# Altium schematic sheet RK3568-DDR-PHY.SchDoc
size 420 x 297 mm; SheetNumber: 5; SheetTotal: 25
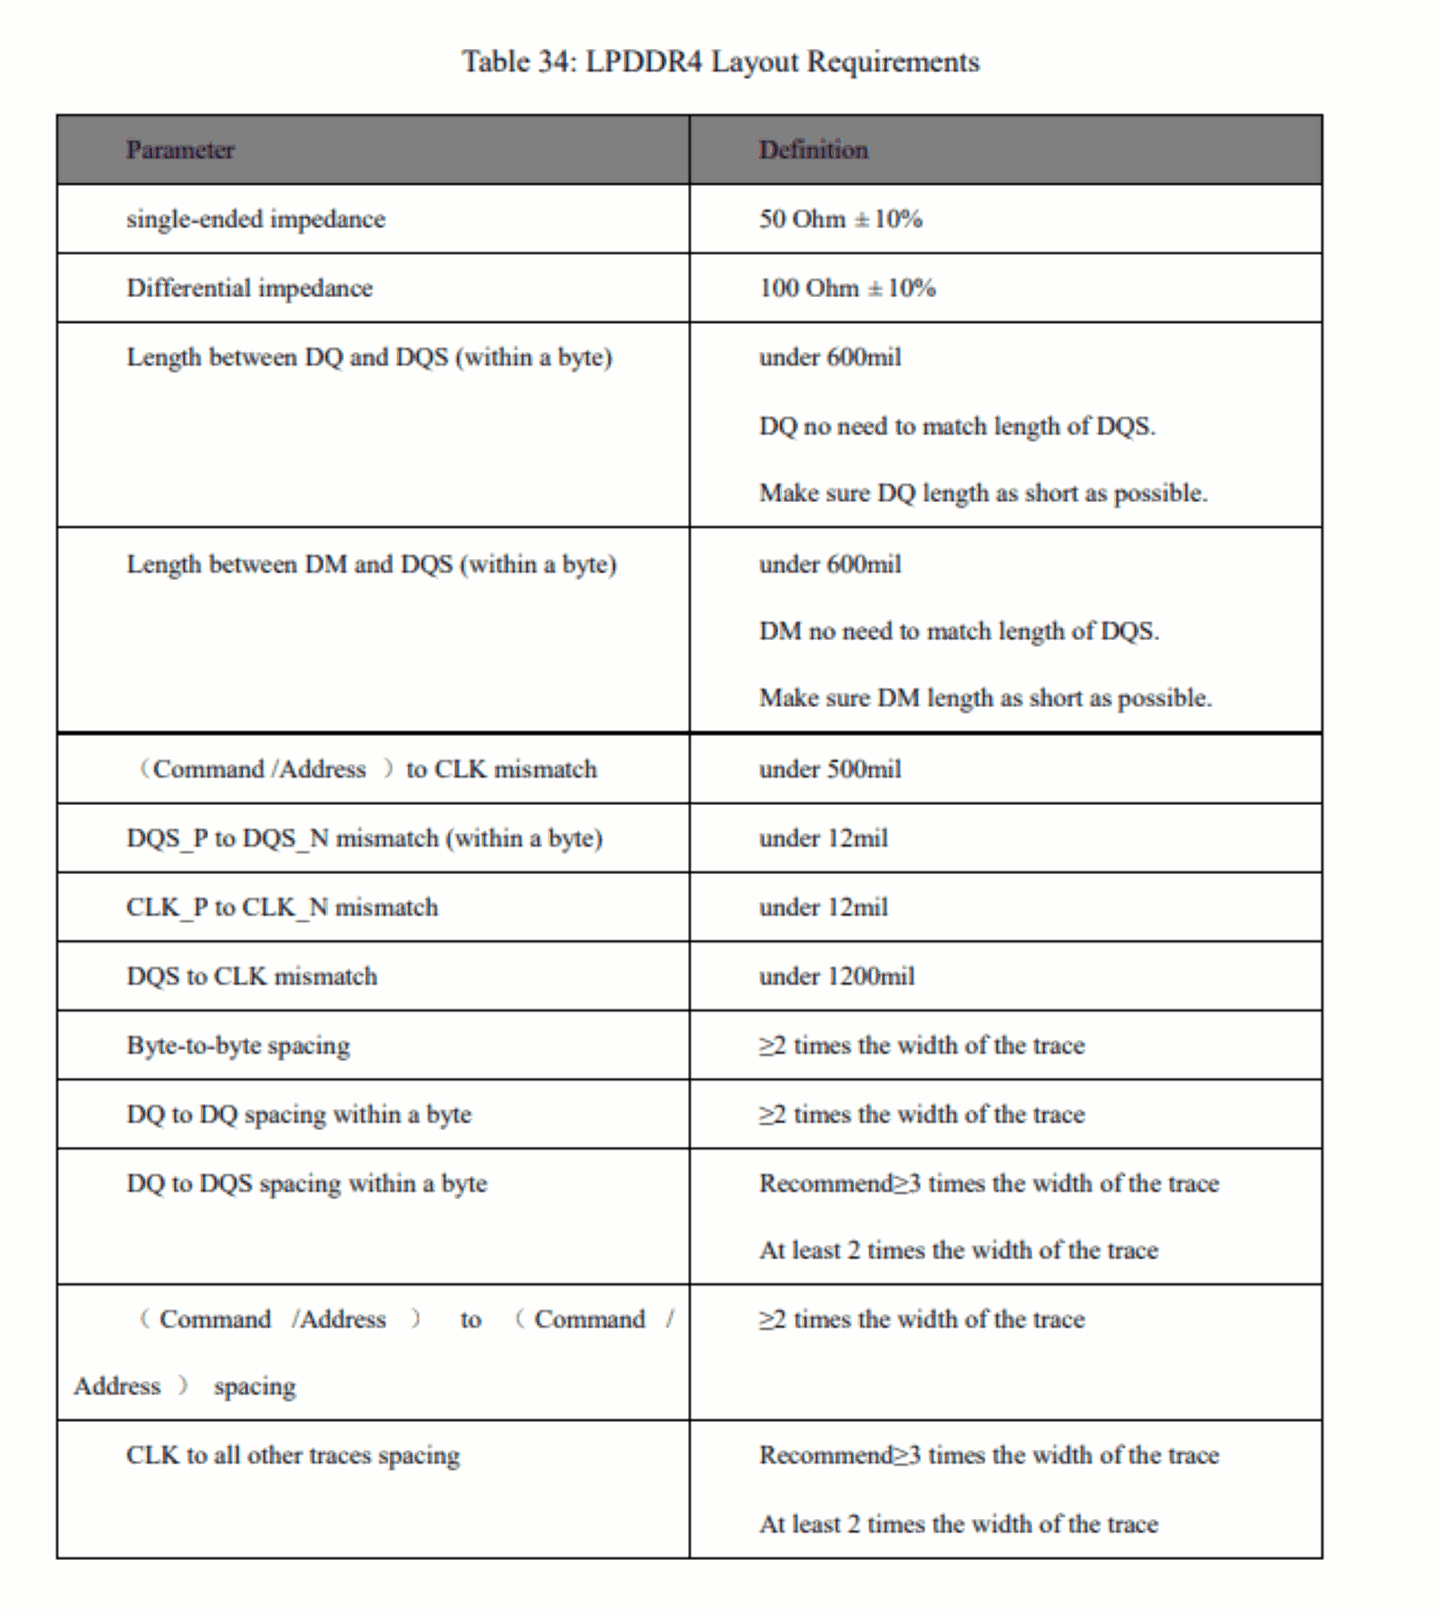
[diagram p0: RK3568-DDR-PHY.SchDoc, left]
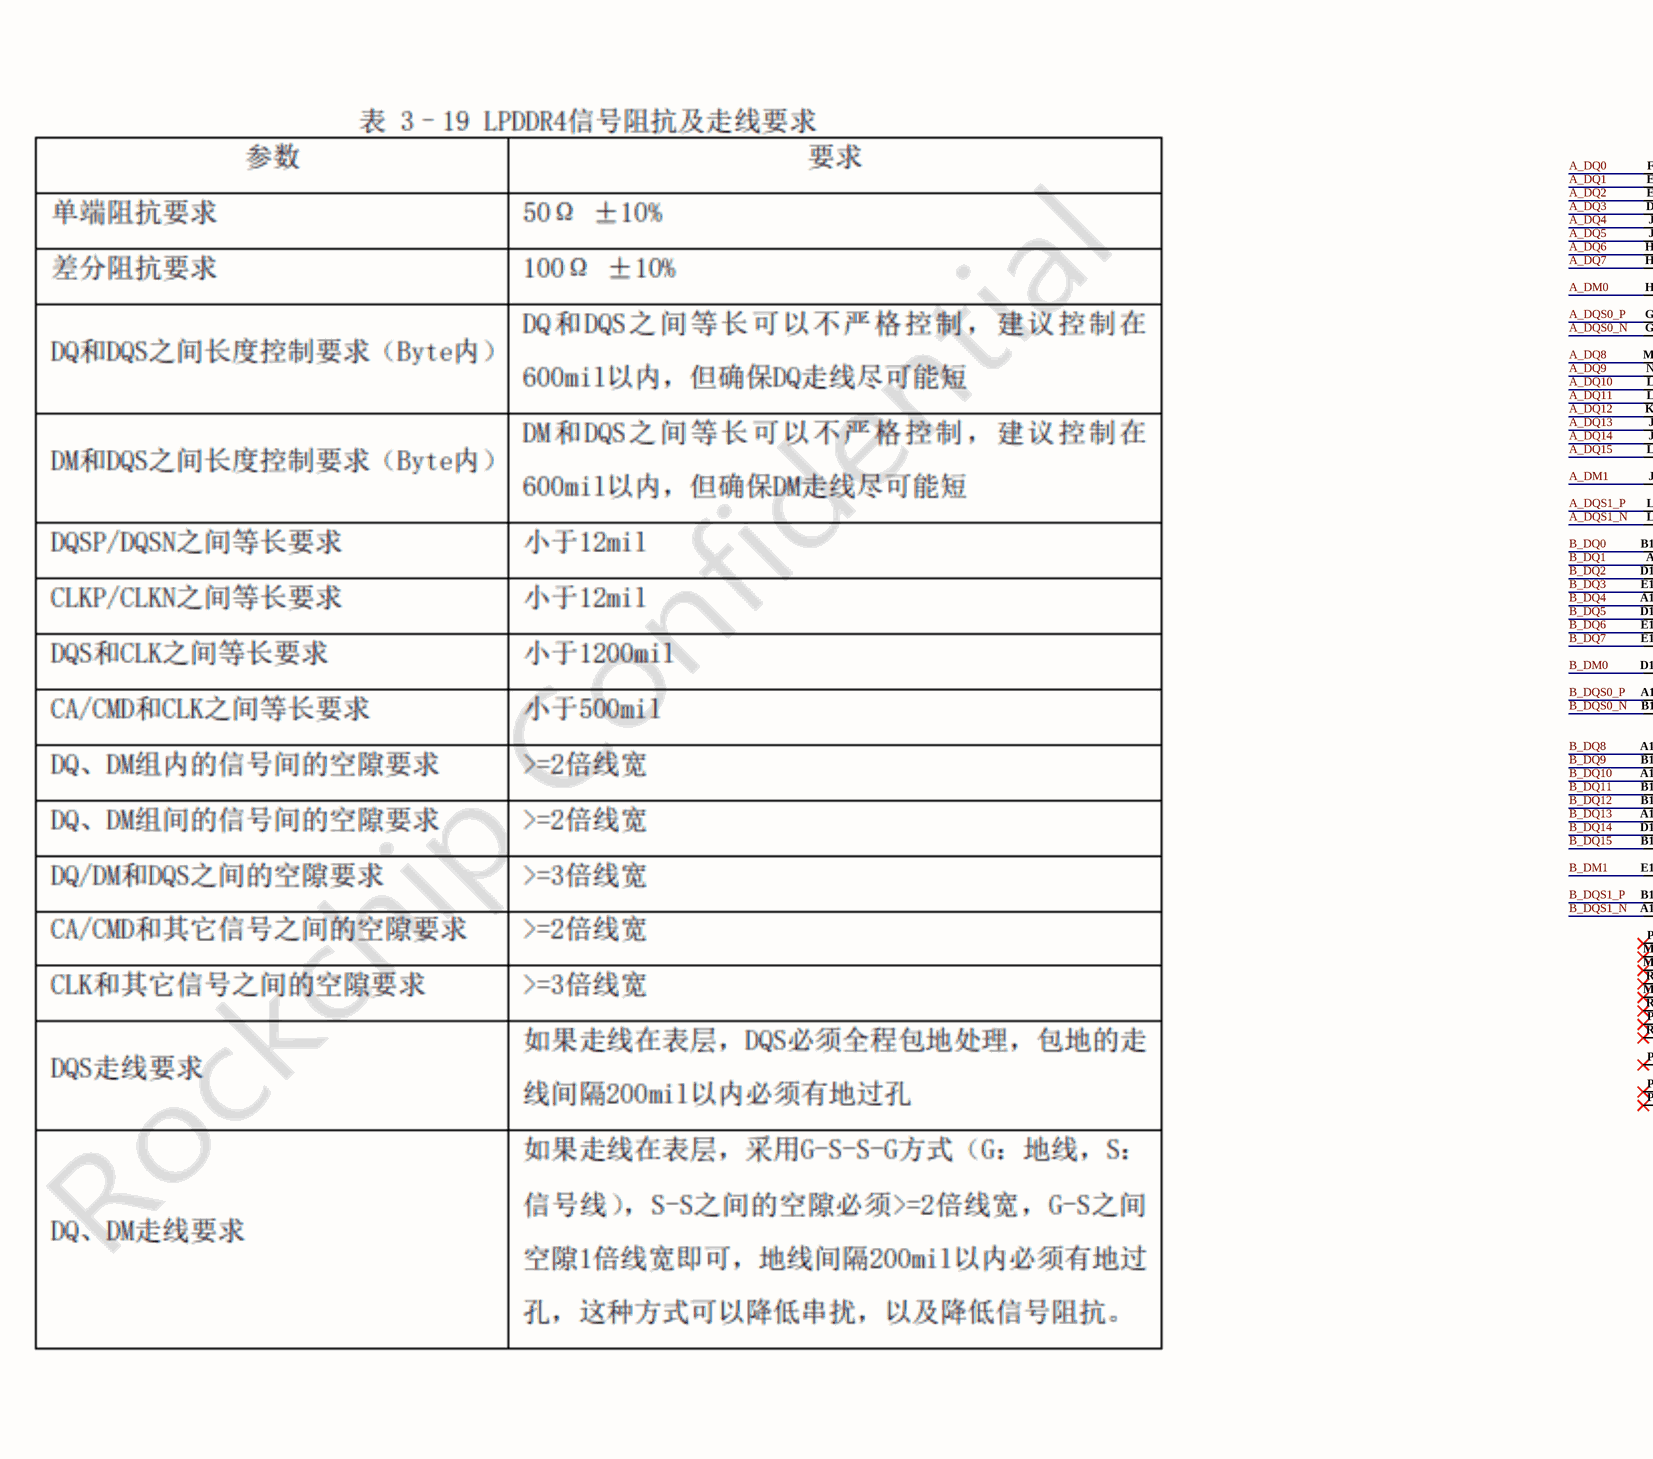
[diagram p1: RK3568-DDR-PHY.SchDoc, middle]
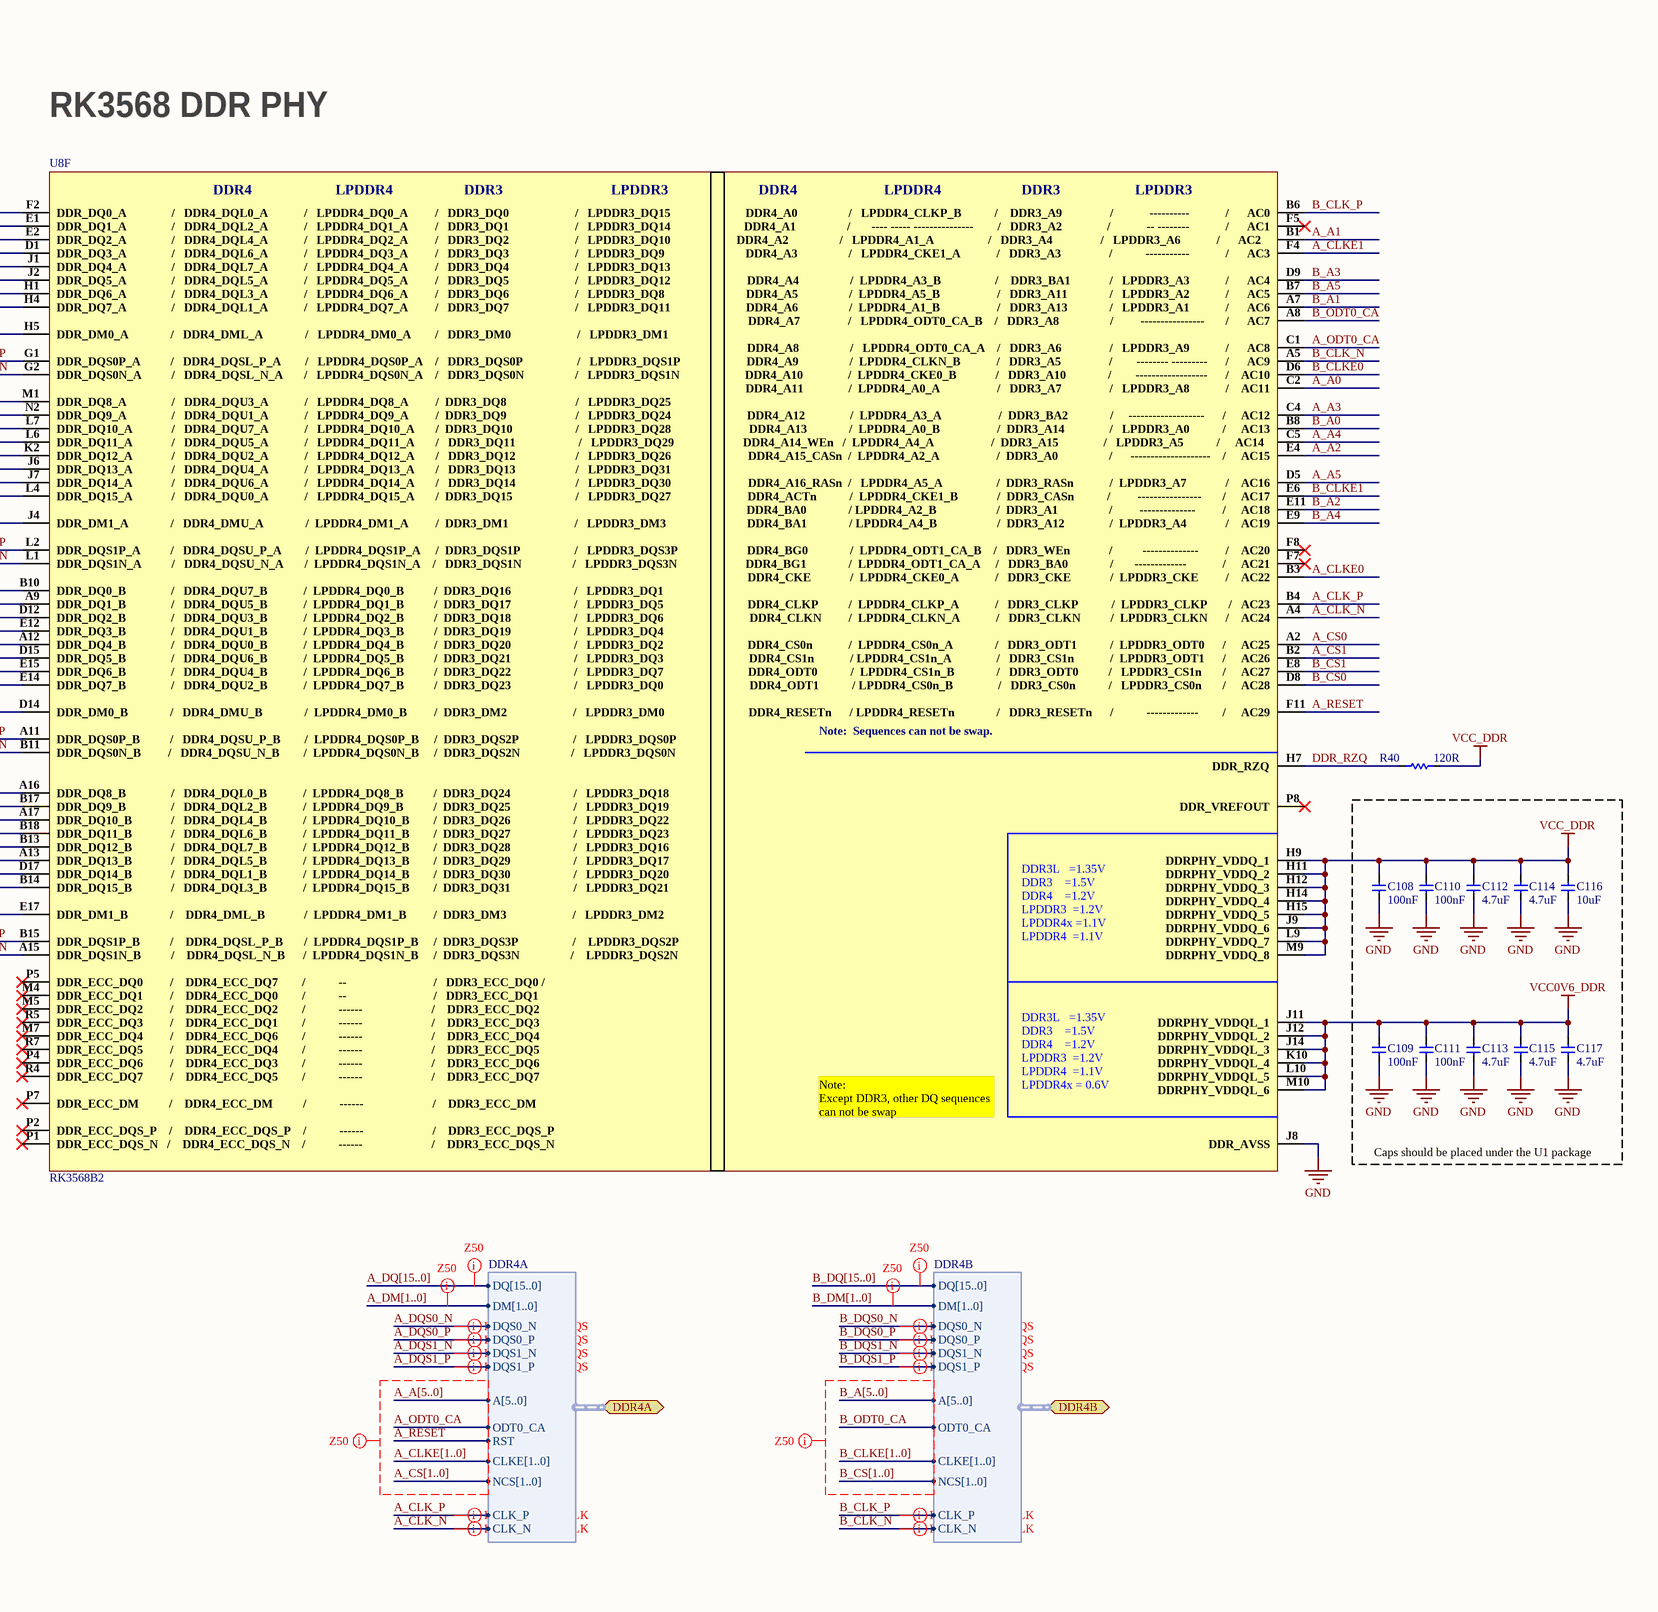
[diagram p2: RK3568-DDR-PHY.SchDoc, right]

## Parts
C108  100nF  [CAP-0201]
C109  100nF  [CAP-0201]
C110  100nF  [CAP-0201]
C111  100nF  [CAP-0201]
C112  4.7uF  [Cap-0402]
C113  4.7uF  [Cap-0402]
C114  4.7uF  [Cap-0402]
C115  4.7uF  [Cap-0402]
C116  10uF  [Cap-0603]
C117  4.7uF  [Cap-0402]
R40  120R  [Res-0201]
U8  RK3568B2  [FCCSP-636L]  (part F of 23)

## Ports
DDR4A (bidir, harness DDR4A, see DRAM-LPDDR4x-Sheet[2A]), DDR4B (bidir, harness DDR4B, see DRAM-LPDDR4x-Sheet[2B])

## Harnesses
DDR4A: DQ[15..0], DM[1..0], DQS0_N, DQS0_P, DQS1_N, DQS1_P, A[5..0], ODT0_CA, RST, CLKE[1..0], NCS[1..0], CLK_P, CLK_N
DDR4B: DQ[15..0], DM[1..0], DQS0_N, DQS0_P, DQS1_N, DQS1_P, A[5..0], ODT0_CA, CLKE[1..0], NCS[1..0], CLK_P, CLK_N

## Nets
GND: C108.1 C109.1 C110.1 C111.1 C112.1 C113.1 C114.1 C115.1 C116.1 C117.1 U8.J8(DDR_AVSS)
VCC0V6_DDR: C109.2 C111.2 C113.2 C115.2 C117.2 U8.J11(DDRPHY_VDDQL_1) U8.J12(DDRPHY_VDDQL_2) U8.J14(DDRPHY_VDDQL_3) U8.K10(DDRPHY_VDDQL_4) U8.L10(DDRPHY_VDDQL_5) U8.M10(DDRPHY_VDDQL_6)
VCC_DDR: C108.2 C110.2 C112.2 C114.2 C116.2 R40.2 U8.H9(DDRPHY_VDDQ_1) U8.H11(DDRPHY_VDDQ_2) U8.H12(DDRPHY_VDDQ_3) U8.H14(DDRPHY_VDDQ_4) U8.H15(DDRPHY_VDDQ_5) U8.J9(DDRPHY_VDDQ_6) U8.L9(DDRPHY_VDDQ_7) U8.M9(DDRPHY_VDDQ_8)
A_A0: U8.C2(DDR4_A11_______________/__LPDDR4_A0_A___________________/___DDR3_A7________________/___LPDDR3_A8____________/____AC11)
A_A1: U8.B1(DDR4_A2_________________/___LPDDR4_A1_A__________________/___DDR3_A4________________/___LPDDR3_A6____________/______AC2)
A_A2: U8.E4(DDR4_A15_CASn__/__LPDDR4_A2_A___________________/__DDR3_A0_________________/______--------------------____/_____AC15)
A_A3: U8.C4(DDR4_A12_______________/__LPDDR4_A3_A___________________/__DDR3_BA2______________/_____-------------------______/_____AC12)
A_A4: U8.C5(DDR4_A14_WEn___/__LPDDR4_A4_A___________________/__DDR3_A15_______________/___LPDDR3_A5___________/_____AC14)
A_A5: U8.D5(DDR4_A16_RASn__/___LPDDR4_A5_A__________________/__DDR3_RASn____________/__LPDDR3_A7_____________/____AC16)
A_CLK_N: U8.A4(DDR4_CLKN_________/__LPDDR4_CLKN_A____________/___DDR3_CLKN__________/__LPDDR3_CLKN______/____AC24) ; port DDR4A.CLK_N
A_CLK_P: U8.B4(DDR4_CLKP__________/__LPDDR4_CLKP_A____________/___DDR3_CLKP___________/__LPDDR3_CLKP_______/___AC23) ; port DDR4A.CLK_P
A_CLKE0: U8.B3(DDR4_CKE_____________/__LPDDR4_CKE0_A____________/___DDR3_CKE_____________/__LPDDR3_CKE_________/____AC22)
A_CLKE1: U8.F4(DDR4_A3_________________/___LPDDR4_CKE1_A____________/___DDR3_A3________________/___________-----------____________/______AC3)
A_CS0: U8.A2(DDR4_CS0n____________/__LPDDR4_CS0n_A______________/___DDR3_ODT1___________/__LPDDR3_ODT0______/_____AC25)
A_CS1: U8.B2(DDR4_CS1n____________/_LPDDR4_CS1n_A_______________/___DDR3_CS1n____________/__LPDDR3_ODT1______/_____AC26)
A_DM0: U8.H5(DDR_DM0_A______________/___DDR4_DML_A______________/___LPDDR4_DM0_A________/___DDR3_DM0______________________/___LPDDR3_DM1)
A_DM1: U8.J4(DDR_DM1_A______________/___DDR4_DMU_A______________/__LPDDR4_DM1_A_________/__DDR3_DM1______________________/___LPDDR3_DM3)
A_DQ0: U8.F2(DDR_DQ0_A_______________/___DDR4_DQL0_A____________/___LPDDR4_DQ0_A_________/___DDR3_DQ0______________________/___LPDDR3_DQ15)
A_DQ1: U8.E1(DDR_DQ1_A_______________/___DDR4_DQL2_A____________/___LPDDR4_DQ1_A_________/___DDR3_DQ1______________________/___LPDDR3_DQ14)
A_DQ2: U8.E2(DDR_DQ2_A_______________/___DDR4_DQL4_A____________/___LPDDR4_DQ2_A_________/___DDR3_DQ2______________________/___LPDDR3_DQ10)
A_DQ3: U8.D1(DDR_DQ3_A_______________/___DDR4_DQL6_A____________/___LPDDR4_DQ3_A_________/___DDR3_DQ3______________________/___LPDDR3_DQ9)
A_DQ4: U8.J1(DDR_DQ4_A_______________/___DDR4_DQL7_A____________/___LPDDR4_DQ4_A_________/___DDR3_DQ4______________________/___LPDDR3_DQ13)
A_DQ5: U8.J2(DDR_DQ5_A_______________/___DDR4_DQL5_A____________/___LPDDR4_DQ5_A_________/___DDR3_DQ5______________________/___LPDDR3_DQ12)
A_DQ6: U8.H1(DDR_DQ6_A_______________/___DDR4_DQL3_A____________/___LPDDR4_DQ6_A_________/___DDR3_DQ6______________________/___LPDDR3_DQ8)
A_DQ7: U8.H4(DDR_DQ7_A_______________/___DDR4_DQL1_A____________/___LPDDR4_DQ7_A_________/___DDR3_DQ7______________________/___LPDDR3_DQ11)
A_DQ8: U8.M1(DDR_DQ8_A_______________/___DDR4_DQU3_A____________/___LPDDR4_DQ8_A_________/__DDR3_DQ8_______________________/___LPDDR3_DQ25)
A_DQ9: U8.N2(DDR_DQ9_A_______________/___DDR4_DQU1_A____________/___LPDDR4_DQ9_A_________/__DDR3_DQ9_______________________/___LPDDR3_DQ24)
A_DQ10: U8.L7(DDR_DQ10_A_____________/___DDR4_DQU7_A____________/___LPDDR4_DQ10_A_______/__DDR3_DQ10_____________________/___LPDDR3_DQ28)
A_DQ11: U8.L6(DDR_DQ11_A_____________/___DDR4_DQU5_A____________/___LPDDR4_DQ11_A_______/___DDR3_DQ11_____________________/___LPDDR3_DQ29)
A_DQ12: U8.K2(DDR_DQ12_A_____________/___DDR4_DQU2_A____________/___LPDDR4_DQ12_A_______/___DDR3_DQ12____________________/___LPDDR3_DQ26)
A_DQ13: U8.J6(DDR_DQ13_A_____________/___DDR4_DQU4_A____________/___LPDDR4_DQ13_A_______/___DDR3_DQ13____________________/___LPDDR3_DQ31)
A_DQ14: U8.J7(DDR_DQ14_A_____________/___DDR4_DQU6_A____________/___LPDDR4_DQ14_A_______/___DDR3_DQ14____________________/___LPDDR3_DQ30)
A_DQ15: U8.L4(DDR_DQ15_A_____________/___DDR4_DQU0_A____________/___LPDDR4_DQ15_A_______/__DDR3_DQ15_____________________/___LPDDR3_DQ27)
A_DQS0_N: U8.G2(DDR_DQS0N_A__________/___DDR4_DQSL_N_A_______/___LPDDR4_DQS0N_A____/___DDR3_DQS0N_________________/___LPDDR3_DQS1N) ; port DDR4A.DQS0_N
A_DQS0_P: U8.G1(DDR_DQS0P_A__________/___DDR4_DQSL_P_A________/___LPDDR4_DQS0P_A____/___DDR3_DQS0P__________________/___LPDDR3_DQS1P) ; port DDR4A.DQS0_P
A_DQS1_N: U8.L1(DDR_DQS1N_A__________/___DDR4_DQSU_N_A_______/__LPDDR4_DQS1N_A____/___DDR3_DQS1N_________________/___LPDDR3_DQS3N) ; port DDR4A.DQS1_N
A_DQS1_P: U8.L2(DDR_DQS1P_A__________/___DDR4_DQSU_P_A________/__LPDDR4_DQS1P_A_____/__DDR3_DQS1P__________________/___LPDDR3_DQS3P) ; port DDR4A.DQS1_P
A_ODT0_CA: U8.C1(DDR4_A8_________________/___LPDDR4_ODT0_CA_A____/___DDR3_A6________________/___LPDDR3_A9____________/______AC8) ; port DDR4A.ODT0_CA
A_RESET: U8.F11(DDR4_RESETn______/_LPDDR4_RESETn______________/___DDR3_RESETn______/___________-------------________/_____AC29) ; port DDR4A.RST
B_A0: U8.B8(DDR4_A13______________/__LPDDR4_A0_B___________________/__DDR3_A14_______________/___LPDDR3_A0___________/_____AC13)
B_A1: U8.A7(DDR4_A6_________________/__LPDDR4_A1_B___________________/___DDR3_A13______________/___LPDDR3_A1____________/______AC6)
B_A2: U8.E11(DDR4_BA0______________/_LPDDR4_A2_B____________________/__DDR3_A1_________________/_________--------------_________/_____AC18)
B_A3: U8.D9(DDR4_A4_________________/__LPDDR4_A3_B__________________/____DDR3_BA1_____________/___LPDDR3_A3____________/______AC4)
B_A4: U8.E9(DDR4_BA1______________/_LPDDR4_A4_B____________________/__DDR3_A12_______________/__LPDDR3_A4_____________/____AC19)
B_A5: U8.B7(DDR4_A5_________________/__LPDDR4_A5_B___________________/___DDR3_A11______________/___LPDDR3_A2____________/______AC5)
B_CLK_N: U8.A5(DDR4_A9_________________/__LPDDR4_CLKN_B____________/___DDR3_A5________________/________--------_---------______/______AC9) ; port DDR4B.CLK_N
B_CLK_P: U8.B6(DDR4_A0_________________/___LPDDR4_CLKP_B___________/____DDR3_A9________________/____________----------____________/______AC0) ; port DDR4B.CLK_P
B_CLKE0: U8.D6(DDR4_A10_______________/__LPDDR4_CKE0_B_____________/___DDR3_A10______________/________------------------______/____AC10)
B_CLKE1: U8.E6(DDR4_ACTn___________/__LPDDR4_CKE1_B_____________/__DDR3_CASn___________/_________----------------_______/_____AC17)
B_CS0: U8.D8(DDR4_ODT1___________/_LPDDR4_CS0n_B_______________/___DDR3_CS0n___________/___LPDDR3_CS0n_______/_____AC28)
B_CS1: U8.E8(DDR4_ODT0___________/__LPDDR4_CS1n_B______________/___DDR3_ODT0__________/___LPDDR3_CS1n_______/_____AC27)
B_DM0: U8.D14(DDR_DM0_B______________/___DDR4_DMU_B______________/__LPDDR4_DM0_B_________/__DDR3_DM2______________________/___LPDDR3_DM0)
B_DM1: U8.E17(DDR_DM1_B______________/____DDR4_DML_B_____________/__LPDDR4_DM1_B_________/__DDR3_DM3______________________/___LPDDR3_DM2)
B_DQ0: U8.B10(DDR_DQ0_B_______________/___DDR4_DQU7_B____________/__LPDDR4_DQ0_B__________/__DDR3_DQ16_____________________/___LPDDR3_DQ1)
B_DQ1: U8.A9(DDR_DQ1_B_______________/___DDR4_DQU5_B____________/__LPDDR4_DQ1_B__________/__DDR3_DQ17_____________________/___LPDDR3_DQ5)
B_DQ2: U8.D12(DDR_DQ2_B_______________/___DDR4_DQU3_B____________/__LPDDR4_DQ2_B__________/__DDR3_DQ18_____________________/___LPDDR3_DQ6)
B_DQ3: U8.E12(DDR_DQ3_B_______________/___DDR4_DQU1_B____________/__LPDDR4_DQ3_B__________/__DDR3_DQ19_____________________/___LPDDR3_DQ4)
B_DQ4: U8.A12(DDR_DQ4_B_______________/___DDR4_DQU0_B____________/__LPDDR4_DQ4_B__________/__DDR3_DQ20_____________________/___LPDDR3_DQ2)
B_DQ5: U8.D15(DDR_DQ5_B_______________/___DDR4_DQU6_B____________/__LPDDR4_DQ5_B__________/__DDR3_DQ21_____________________/___LPDDR3_DQ3)
B_DQ6: U8.E15(DDR_DQ6_B_______________/___DDR4_DQU4_B____________/__LPDDR4_DQ6_B__________/__DDR3_DQ22_____________________/___LPDDR3_DQ7)
B_DQ7: U8.E14(DDR_DQ7_B_______________/___DDR4_DQU2_B____________/__LPDDR4_DQ7_B__________/__DDR3_DQ23_____________________/___LPDDR3_DQ0)
B_DQ8: U8.A16(DDR_DQ8_B_______________/___DDR4_DQL0_B____________/__LPDDR4_DQ8_B__________/__DDR3_DQ24_____________________/___LPDDR3_DQ18)
B_DQ9: U8.B17(DDR_DQ9_B_______________/___DDR4_DQL2_B____________/__LPDDR4_DQ9_B__________/__DDR3_DQ25_____________________/___LPDDR3_DQ19)
B_DQ10: U8.A17(DDR_DQ10_B_____________/___DDR4_DQL4_B____________/__LPDDR4_DQ10_B________/__DDR3_DQ26_____________________/___LPDDR3_DQ22)
B_DQ11: U8.B18(DDR_DQ11_B_____________/___DDR4_DQL6_B____________/__LPDDR4_DQ11_B________/__DDR3_DQ27_____________________/___LPDDR3_DQ23)
B_DQ12: U8.B13(DDR_DQ12_B_____________/___DDR4_DQL7_B____________/__LPDDR4_DQ12_B________/__DDR3_DQ28_____________________/___LPDDR3_DQ16)
B_DQ13: U8.A13(DDR_DQ13_B_____________/___DDR4_DQL5_B____________/__LPDDR4_DQ13_B________/__DDR3_DQ29_____________________/___LPDDR3_DQ17)
B_DQ14: U8.D17(DDR_DQ14_B_____________/___DDR4_DQL1_B____________/__LPDDR4_DQ14_B________/__DDR3_DQ30_____________________/___LPDDR3_DQ20)
B_DQ15: U8.B14(DDR_DQ15_B_____________/___DDR4_DQL3_B____________/__LPDDR4_DQ15_B________/__DDR3_DQ31_____________________/___LPDDR3_DQ21)
B_DQS0_N: U8.B11(DDR_DQS0N_B_________/___DDR4_DQSU_N_B________/__LPDDR4_DQS0N_B_____/__DDR3_DQS2N_________________/___LPDDR3_DQS0N) ; port DDR4B.DQS0_N
B_DQS0_P: U8.A11(DDR_DQS0P_B__________/___DDR4_DQSU_P_B________/__LPDDR4_DQS0P_B_____/__DDR3_DQS2P__________________/___LPDDR3_DQS0P) ; port DDR4B.DQS0_P
B_DQS1_N: U8.A15(DDR_DQS1N_B__________/____DDR4_DQSL_N_B______/__LPDDR4_DQS1N_B_____/__DDR3_DQS3N_________________/____LPDDR3_DQS2N) ; port DDR4B.DQS1_N
B_DQS1_P: U8.B15(DDR_DQS1P_B__________/____DDR4_DQSL_P_B_______/__LPDDR4_DQS1P_B_____/__DDR3_DQS3P__________________/____LPDDR3_DQS2P) ; port DDR4B.DQS1_P
B_ODT0_CA: U8.A8(DDR4_A7________________/___LPDDR4_ODT0_CA_B____/___DDR3_A8_________________/_________----------------_______/______AC7) ; port DDR4B.ODT0_CA
DDR_RZQ: R40.1 U8.H7(DDR_RZQ)

Not connected (* = marked no-connect by the designer): U8 F5(DDR4_A1_________________/_______----_-----_---------------________/___DDR3_A2_______________/____________--_--------____________/______AC1)* F7(DDR4_BG1______________/__LPDDR4_ODT1_CA_A_____/___DDR3_BA0______________/_______-------------____________/_____AC21)* F8(DDR4_BG0______________/__LPDDR4_ODT1_CA_B____/___DDR3_WEn_____________/__________--------------_________/____AC20)* M4(DDR_ECC_DQ1_________/____DDR4_ECC_DQ0________/___________--_____________________________/___DDR3_ECC_DQ1)* M5(DDR_ECC_DQ2_________/____DDR4_ECC_DQ2________/___________------_______________________/____DDR3_ECC_DQ2)* M7(DDR_ECC_DQ4_________/____DDR4_ECC_DQ6________/___________------_______________________/____DDR3_ECC_DQ4)* P1(DDR_ECC_DQS_N___/____DDR4_ECC_DQS_N____/___________------_______________________/____DDR3_ECC_DQS_N)* P2(DDR_ECC_DQS_P____/____DDR4_ECC_DQS_P____/___________------_______________________/____DDR3_ECC_DQS_P)* P4(DDR_ECC_DQ6_________/____DDR4_ECC_DQ3________/___________------_______________________/____DDR3_ECC_DQ6)* P5(DDR_ECC_DQ0_________/____DDR4_ECC_DQ7________/___________--_____________________________/___DDR3_ECC_DQ0_/________)* P7(DDR_ECC_DM__________/____DDR4_ECC_DM__________/___________------_______________________/____DDR3_ECC_DM)* P8(DDR_VREFOUT)* R4(DDR_ECC_DQ7_________/____DDR4_ECC_DQ5________/___________------_______________________/____DDR3_ECC_DQ7)* R5(DDR_ECC_DQ3_________/____DDR4_ECC_DQ1________/___________------_______________________/____DDR3_ECC_DQ3)* R7(DDR_ECC_DQ5_________/____DDR4_ECC_DQ4________/___________------_______________________/____DDR3_ECC_DQ5)*

## Buses and harness runs
bus A_A[5..0]
bus A_CLKE[1..0]
bus A_CS[1..0]
bus A_DM[1..0]
bus A_DQ[15..0]
bus B_A[5..0]
bus B_CLKE[1..0]
bus B_CS[1..0]
bus B_DM[1..0]
bus B_DQ[15..0]

## Layout directives
net class 50OHM_DDR: (no net found under the mark), A_A[5..0], A_CLKE[1..0], A_CS[1..0], A_ODT0_CA, A_RESET, B_A[5..0], B_CLKE[1..0], B_CS[1..0], B_ODT0_CA
differential pair; differential pair class 100OHM_DDR_DQS: A_DQS0_N, A_DQS0_P, A_DQS1_N, A_DQS1_P, B_DQS0_N, B_DQS0_P, B_DQS1_N, B_DQS1_P
differential pair; differential pair class 100OHM_DDR_CLK: A_CLK_N, A_CLK_P, B_CLK_N, B_CLK_P

## Notes on the sheet
- RK3568 DDR PHY
- Caps should be placed under the U1 package
- File:
- Title:
- Date:
- Page
- Num:
- Total:
- Drawn By: Huzaifa Ali
- (in symbol RK3568B2, part F) DDR4; LPDDR4; DDR3; LPDDR3; Note:  Sequences can not be swap.; DDR3L   =1.35V / DDR3    =1.5V / DDR4    =1.2V / LPDDR3  =1.2V / LPDDR4x =1.1V / LPDDR4  =1.1V; DDR3L   =1.35V / DDR3    =1.5V / DDR4    =1.2V / LPDDR3  =1.2V / LPDDR4  =1.1V / LPDDR4x = 0.6V /; Note: / Except DDR3, other DQ sequences / can not be swap

## Library data of the parts
C108-C111 = CC0201KRX5R6BB104: CAP CER 0.1UF 10V X5R 0201; Manufacturer: Yageo; Tolerance: 10%; Supplier 1: Mouser; Manufacturer Part Number: CC0201KRX5R6BB104; RoHS: Yes; Category: Ceramic Capacitors; Stock 1: 824403; Pricing 1: 1=0.10000, 10=0.02400, 50=0.02400, 100=0.01900, 1000=0.01100, 10000=0.00900 (USD); Mount: Surface Mount; Case/Package: 0201; Case Code (Imperial): 0201; Case Code (Metric): 0603; Weight: 6E-06oz; Min Operating Temperature: -55°C; Max Operating Temperature: 85°C; Capacitance: 100nF; Dielectric: X5R; Voltage Rating (DC): 10V; Packaging: Tape and Reel; Termination: SMD/SMT; Resistor Type: Ceramic; Voltage Rating: 10V; Series: CC; Construction: Flat; Length: 0.6mm; Width: 0.012inch; Height: 0.3mm; Thickness: 0.013inch; Depth: 0.3mm; Radiation Hardening: No; Lead Free: Lead Free; Halogen Free: Halogen Free; RoHS Compliant: Yes; ComponentLink1URL: https://datasheet.ciiva.com/11587/upy-gphc-x5r-4v-to-50v-12-11587190.pdf?src-supplier=Avnet; ComponentLink1Description: https://datasheet.ciiva.com/11587/upy-gphc-x5r-4v-to-50v-12-11587190.pdf?src-supplier=Avnet; Supplier Part Number 1: 603-CC201KRX5R6BB104; LCSC Part Number: C190183
C112-C115 C117 = CC0402KRX5R5BB475: CAP CER 4.7UF 6.3V X5R 0402; Manufacturer: Yageo; Tolerance: 10%; Item Type: Capacitor; Supplier 1: Arrow Electronics; Manufacturer Part Number: CC0402KRX5R5BB475; RoHS: Yes; Category: Ceramic Capacitors; Stock 1: 890000; Pricing 1: 10000=0.02120, 20000=0.02030, 30000=0.02010, 50000=0.01930, 100000=0.01760, 250000=0.01630 (USD); Case/Package: 0402; Voltage Rating (DC): 6.3V; Dielectric: X5R; Capacitance: 4.7uF; Lead Free: Lead Free; Halogen Free: Halogen Free; RoHS Compliant: Yes; ComponentLink1URL: http://www.yageo.com/documents/recent/UPY-GPHC_X5R_4V-to-50V_25.pdf?src-supplier=Digi-Key; ComponentLink1Description: http://www.yageo.com/documents/recent/UPY-GPHC_X5R_4V-to-50V_25.pdf?src-supplier=Digi-Key; ComponentLink2URL: https://www.yageo.com/upload/media/product/productsearch/datasheet/mlcc/UPY-GPHC_X5R_4V-to-50V_26.pdf?src-supplier=Digi-Key; ComponentLink2Description: https://www.yageo.com/upload/media/product/productsearch/datasheet/mlcc/UPY-GPHC_X5R_4V-to-50V_26.pdf?src-supplier=Digi-Key; LCSC Part Number: C541466; Supplier Part Number 1: CC0402KRX5R5BB475
C116 = GRM188R60J106ME47D: CAP CER 10UF 6.3V X5R 0603; Manufacturer: Murata; Material: Ceramic; Tolerance: 20%; Item Type: Capacitor; Supplier 1: Avnet; Manufacturer Part Number: GRM188R60J106ME47D; RoHS: Yes; Category: Ceramic Capacitors; Stock 1: 513625; Pricing 1: 4000=0.02461, 8000=0.02328, 16000=0.02195, 24000=0.02062, 32000=0.01929, 40000=0.01796, 400000=0.01663 (USD); Mount: Surface Mount; Case/Package: 0603; Case Code (Metric): 1608; Case Code (Imperial): 0603; Weight: 0.000222oz; Min Operating Temperature: -55°C; Max Operating Temperature: 85°C; Capacitance: 10uF; Dielectric: X5R; Packaging: Cut Tape; Package Quantity: 4000; Voltage Rating: 6.3V; Voltage Rating (DC): 6.3V; Termination: Standard; Voltage: 6.3V; Series: GRM; Length: 1.6mm; Width: 0.8mm; Height: 0.8mm; Thickness: 0.035inch; Depth: 0.8mm; Radiation Hardening: No; Reach SVHC Compliant: Yes; Lead Free: Lead Free; RoHS Compliant: Yes; ComponentLink1URL: https://datasheet.ciiva.com/22776/1747457-22776418.pdf?src-supplier=Farnell; ComponentLink1Description: https://datasheet.ciiva.com/22776/1747457-22776418.pdf?src-supplier=Farnell; ComponentLink2URL: https://datasheet.ciiva.com/28584/415295-28584232.pdf?src-supplier=Element14; ComponentLink2Description: https://datasheet.ciiva.com/28584/415295-28584232.pdf?src-supplier=Element14; ComponentLink3URL: https://datasheet.ciiva.com/3777/10175grm188r60j106me4723-3777268.pdf?src-supplier=Arrow+Electronics; ComponentLink3Description: https://datasheet.ciiva.com/3777/10175grm188r60j106me4723-3777268.pdf?src-supplier=Arrow+Electronics; ComponentLink4URL: https://datasheet.ciiva.com/29202/450781-da-01-de-vs-chip-kond-0603-10-0-uf-20pr-6-3v-x5r-29202806.pdf?src-supplier=Conrad; ComponentLink4Description: https://datasheet.ciiva.com/29202/450781-da-01-de-vs-chip-kond-0603-10-0-uf-20pr-6-3v-x5r-29202806.pdf?src-supplier=Conrad; ComponentLink5URL: https://datasheet.ciiva.com/29199/454401-da-01-en-vs-kondensator-0603-29199677.pdf?src-supplier=Conrad; ComponentLink5Description: https://datasheet.ciiva.com/29199/454401-da-01-en-vs-kondensator-0603-29199677.pdf?src-supplier=Conrad; ComponentLink6URL: https://datasheet.ciiva.com/14116/grmseries-highdielectrictype-eng-14116428.pdf?src-supplier=Distrelec; ComponentLink6Description: https://datasheet.ciiva.com/14116/grmseries-highdielectrictype-eng-14116428.pdf?src-supplier=Distrelec; ComponentLink7URL: https://datasheet.ciiva.com/138/partnumbering-e-01-138659.pdf?src-supplier=Digi-Key; ComponentLink7Description: https://datasheet.ciiva.com/138/partnumbering-e-01-138659.pdf?src-supplier=Digi-Key; ComponentLink8URL: https://datasheet.ciiva.com/138/partnumbering-e-01-138658.pdf?src-supplier=Digi-Key; ComponentLink8Description: https://datasheet.ciiva.com/138/partnumbering-e-01-138658.pdf?src-supplier=Digi-Key; ComponentLink9URL: https://datasheet.ciiva.com/138/partnumbering-e-01-138660.pdf?src-supplier=Digi-Key; ComponentLink9Description: https://datasheet.ciiva.com/138/partnumbering-e-01-138660.pdf?src-supplier=Digi-Key; ComponentLink10URL: https://datasheet.ciiva.com/16373/l0005e-16373580.pdf?src-supplier=Future+Electronics; ComponentLink10Description: https://datasheet.ciiva.com/16373/l0005e-16373580.pdf?src-supplier=Future+Electronics; Supplier Part Number 1: GRM188R60J106ME47D; LCSC Part Number: C77041
R40 = RC0201FR-07120RL: RES 120 OHM 1% 1/20W 0201; Manufacturer: Yageo; Item Type: Resistor; Supplier: Digikey; Supplier Part Number: 311-120MCT-ND; Manufacturer Part Number: RC0201FR-07120RL; RoHS: Yes; Category: Chip SMD Resistors; Stock: 38339; Pricing: 1=0.1, 10=0.027, 50=0.0172, 100=0.0143, 500=0.00988, 1000=0.00854, 5000=0.00629 (USD); Lead Free: 5697LeadFree; ComponentLink1URL: https://datasheet.ciiva.com/2525/pyu-r-int-thick-7-2525064.pdf?src-supplier=Digikey; ComponentLink1Description: https://datasheet.ciiva.com/2525/pyu-r-int-thick-7-2525064.pdf?src-supplier=Digikey; ComponentLink2URL: https://datasheet.ciiva.com/22661/1563626-22661285.pdf?src-supplier=Element14; ComponentLink2Description: https://datasheet.ciiva.com/22661/1563626-22661285.pdf?src-supplier=Element14; ComponentLink3URL: https://datasheet.ciiva.com/2525/pyu-r-int-thick-7-2525062.pdf?src-supplier=Digikey; ComponentLink3Description: https://datasheet.ciiva.com/2525/pyu-r-int-thick-7-2525062.pdf?src-supplier=Digikey; ComponentLink4URL: https://datasheet.ciiva.com/2525/pyu-r-int-thick-7-2525063.pdf?src-supplier=Digikey; ComponentLink4Description: https://datasheet.ciiva.com/2525/pyu-r-int-thick-7-2525063.pdf?src-supplier=Digikey; LCSC Part Number: C295718
U8 = RK3568B2: FCCSP-636L Microcontroller Units (MCUs/MPUs/SOCs) ROHS; Manufacturer: Rockchip; Item Type: IC; Manufacturer Part Number: RK3568B2; Package: FCCSP-636L; LCSC Part Number: C3345225